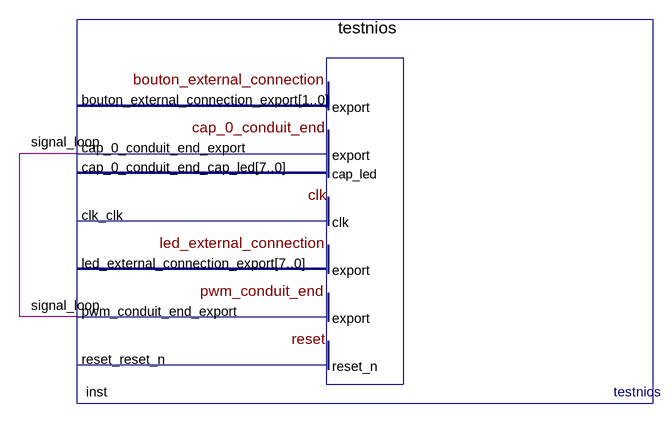
[diagram p0: schematic sheet]
// Quartus schematic testnios_bsf.bdf as structural Verilog: 1 symbols, 0 pins
module testnios_bsf (
);

  wire signal_loop;

  testnios inst (
    .cap_0_conduit_end_export(signal_loop), .pwm_conduit_end_export(signal_loop));  // open: bouton_external_connection_export, clk_clk, reset_reset_n, cap_0_conduit_end_cap_led, led_external_connection_export
endmodule
